# Altium schematic sheet Top_Sheet.SchDoc
size 420 x 297 mm; SheetNumber: 1; SheetTotal: 3
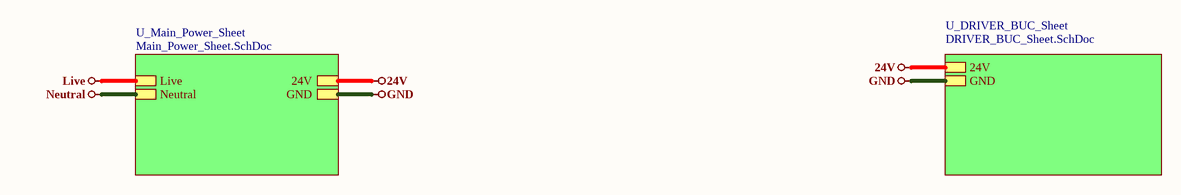
[diagram p0: Top_Sheet.SchDoc]

## Sub-sheets
U_DRIVER_BUC_Sheet = DRIVER_BUC_Sheet.SchDoc: 24V, GND
U_Main_Power_Sheet = Main_Power_Sheet.SchDoc: 24V, GND, Live, Neutral

## Nets
24V: sheet U_DRIVER_BUC_Sheet/24V, sheet U_Main_Power_Sheet/24V
GND: sheet U_DRIVER_BUC_Sheet/GND, sheet U_Main_Power_Sheet/GND
Live: sheet U_Main_Power_Sheet/Live
Neutral: sheet U_Main_Power_Sheet/Neutral

## Notes on the sheet
- File:
- Title:
- Date:
- Page
- Num:
- Total:
- Drawn By: Huzaifa Ali